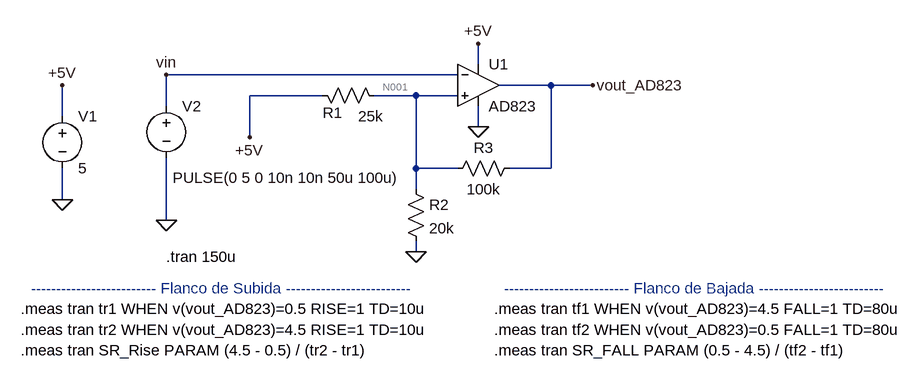
[diagram p0: schematic Diseño.asc]
Diseño.asc, the LTspice schematic file:
Version 4.1
SHEET 1 940 680
WIRE 208 96 208 64
WIRE 176 112 -272 112
WIRE 320 128 240 128
WIRE 384 128 320 128
WIRE -32 144 -144 144
WIRE 112 144 48 144
WIRE 176 144 112 144
WIRE -272 160 -272 112
WIRE -432 176 -432 128
WIRE 208 192 208 160
WIRE -144 208 -144 144
WIRE 112 256 112 144
WIRE 176 256 112 256
WIRE 320 256 320 128
WIRE 320 256 256 256
WIRE 112 288 112 256
WIRE -432 304 -432 256
WIRE -272 336 -272 240
WIRE 112 384 112 368
FLAG 112 384 0
FLAG -272 336 0
FLAG -432 304 0
FLAG -432 128 +5V
FLAG 208 64 +5V
FLAG -144 208 +5V
FLAG 208 192 0
FLAG -272 112 vin
FLAG 384 128 vout_AD823
SYMBOL res -48 128 M90
WINDOW 0 58 32 VBottom 2
WINDOW 3 32 91 VTop 2
SYMATTR InstName R1
SYMATTR Value 25k
SYMBOL res 96 272 R0
SYMATTR InstName R2
SYMATTR Value 20k
SYMBOL voltage -432 160 R0
SYMATTR InstName V1
SYMATTR Value 5
SYMBOL res 272 240 R90
WINDOW 0 0 56 VBottom 2
WINDOW 3 32 56 VTop 2
SYMATTR InstName R3
SYMATTR Value 100k
SYMBOL voltage -272 144 R0
WINDOW 3 10 126 Left 2
WINDOW 123 0 0 Left 0
WINDOW 39 0 0 Left 0
SYMATTR Value PULSE(0 5 0 10n 10n 50u 100u)
SYMATTR InstName V2
SYMBOL OpAmps\\AD823 208 64 R0
SYMATTR InstName U1
TEXT -272 392 Left 2 !.tran 150u
TEXT -496 472 Left 2 !.meas tran tr1 WHEN v(vout_AD823)=0.5 RISE=1 TD=10u
TEXT -496 504 Left 2 !.meas tran tr2 WHEN v(vout_AD823)=4.5 RISE=1 TD=10u
TEXT -496 536 Left 2 !.meas tran SR_Rise PARAM (4.5 - 0.5) / (tr2 - tr1)
TEXT -480 440 Left 2 ;------------------------- Flanco de Subida -------------------------
TEXT 232 504 Left 2 !.meas tran tf2 WHEN v(vout_AD823)=0.5 FALL=1 TD=80u
TEXT 232 472 Left 2 !.meas tran tf1 WHEN v(vout_AD823)=4.5 FALL=1 TD=80u
TEXT 232 536 Left 2 !.meas tran SR_FALL PARAM (0.5 - 4.5) / (tf2 - tf1)
TEXT 248 440 Left 2 ;------------------------- Flanco de Bajada -------------------------

The netlist it stands for:
* Diseño.asc
R1 +5V N001 25k
R2 N001 0 20k
V1 +5V 0 5
R3 vout_AD823 N001 100k
V2 vin 0 PULSE(0 5 0 10n 10n 50u 100u)
X§U1 N001 vin +5V 0 vout_AD823 AD823  ; pins In+ In- V+ V- OUT
.tran 150u
.meas tran tr1 WHEN v(vout_AD823)=0.5 RISE=1 TD=10u
.meas tran tr2 WHEN v(vout_AD823)=4.5 RISE=1 TD=10u
.meas tran SR_Rise PARAM (4.5 - 0.5) / (tr2 - tr1)
* ------------------------- Flanco de Subida -------------------------
.meas tran tf2 WHEN v(vout_AD823)=0.5 FALL=1 TD=80u
.meas tran tf1 WHEN v(vout_AD823)=4.5 FALL=1 TD=80u
.meas tran SR_FALL PARAM (0.5 - 4.5) / (tf2 - tf1)
* ------------------------- Flanco de Bajada -------------------------
.lib ADI.lib
.backanno
.end

* Results of the author's LTspice run, read from the files saved beside the schematic
* Operating Point, zero values left out:
*   V(+5v) = 5 V
*   V(n001) = 2.496 V
*   V(vout_ad823) = 4.963 V
*   I(R1) = 100.1 µA
*   I(R2) = 124.8 µA
*   I(R3) = 24.66 µA
*   I(V1) = -2.841 mA
*   I(V2) = 5.25 pA
*   Ix(u1:1) = -5 pA
*   Ix(u1:2) = -5.25 pA
*   Ix(u1:3) = 2.741 mA
*   Ix(u1:4) = -2.691 mA
*   Ix(u1:5) = -24.66 µA
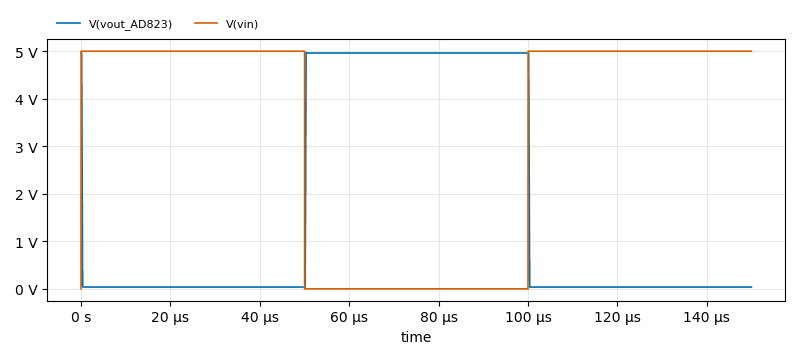
[diagram p1: Transient Analysis of Diseño.asc, plotted from the saved traces]
* Transient Analysis, 1 run:
*   V(vout_AD823): min 36.91 mV, max 4.963 V, average 1.687 V, rms 2.87 V, last 37.02 mV
*   V(vin): min 0 V, max 5 V, average 3.334 V, rms 4.083 V, last 5 V
* From the log:
*   tr1: v(vout_AD823)=0.5  AT 5.01814065156e-05
*   tr2: v(vout_AD823)=4.5  AT 5.0339821938e-05
*   sr_rise: (4.5 - 0.5) / (tr2 - tr1)=25250066.812
*   tf2: v(vout_AD823)=0.5  AT 0.000100328208672
*   tf1: v(vout_AD823)=4.5  AT 0.000100170629126
*   sr_fall: (0.5 - 4.5) / (tf2 - tf1)=-25384005.0851